# Altium project a4403-ELE-CAD.PrjPcb (part 3 of 4)

## Sheet JigInterface.SchDoc
size Letter; SheetNumber: 7; SheetTotal: 15
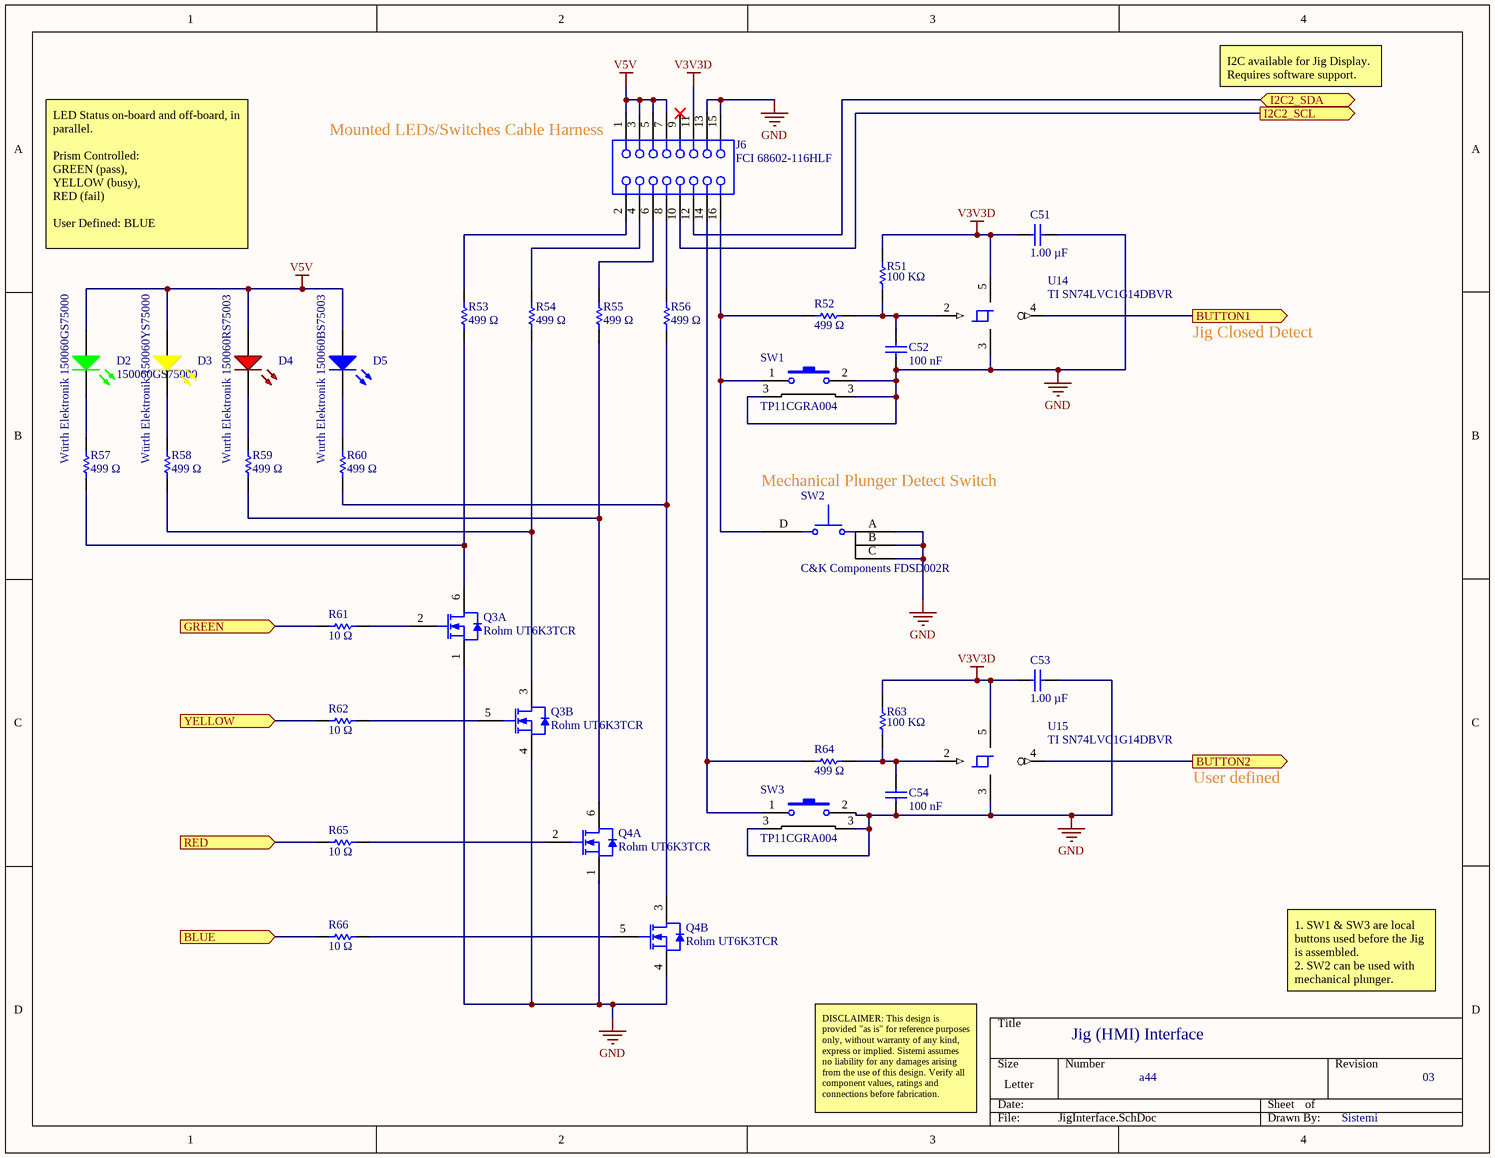
[diagram p8: JigInterface.SchDoc]

### Parts
C51  Capacitance: 1.00 µF  [CAPC1608X90X35NL15T15]  (hidden comment: Samsung CL10B105KA8NNNC)
C52  Capacitance: 100 nF  [CAPC1005X56X25NL10T15]  (hidden comment: Samsung CL05B104KO5NNNC)
C53  Capacitance: 1.00 µF  [CAPC1608X90X35NL15T15]  (hidden comment: Samsung CL10B105KA8NNNC)
C54  Capacitance: 100 nF  [CAPC1005X56X25NL10T15]  (hidden comment: Samsung CL05B104KO5NNNC)
D2  Würth Elektronik 150060GS75000  Manufacturer Part Number: 150060GS75000  [PCB-5fu3j7c0qqekthrt71i6-1]
D3  Würth Elektronik 150060YS75000  [PCB-zc2vv3u4p0giaiwimi3e-1]
D4  Wurth Elektronik 150060RS75003  [Wurth Elektronik 150060RS75003-Footprint-1]
D5  Wurth Elektronik 150060BS75003  [0603D_C]
J6  FCI 68602-116HLF  [HEADER8X2]
Q3  Rohm UT6K3TCR  [DFN2020-8D]  (parts A,B of 2)
Q4  Rohm UT6K3TCR  [DFN2020-8D]  (parts A,B of 2)
R51  Resistance: 100 KΩ  [RESC1005X40X25NL05T05]  (hidden comment: 100 KΩ,±1%,0402)
R52  Resistance: 499 Ω  [RESC1608X55X30ML15T15]  (hidden comment: Generic RES 0603)
R53  Resistance: 499 Ω  [RESC1608X55X30ML15T15]  (hidden comment: Generic RES 0603)
R54  Resistance: 499 Ω  [RESC1608X55X30ML15T15]  (hidden comment: Generic RES 0603)
R55  Resistance: 499 Ω  [RESC1608X55X30ML15T15]  (hidden comment: Generic RES 0603)
R56  Resistance: 499 Ω  [RESC1608X55X30ML15T15]  (hidden comment: Generic RES 0603)
R57  Resistance: 499 Ω  [RESC1608X55X30ML15T15]  (hidden comment: Generic RES 0603)
R58  Resistance: 499 Ω  [RESC1608X55X30ML15T15]  (hidden comment: Generic RES 0603)
R59  Resistance: 499 Ω  [RESC1608X55X30ML15T15]  (hidden comment: Generic RES 0603)
R60  Resistance: 499 Ω  [RESC1608X55X30ML15T15]  (hidden comment: Generic RES 0603)
R61  Resistance: 10 Ω  [RESC1005X40X25NL05T05]  (hidden comment: 10 Ω,±1%,0402)
R62  Resistance: 10 Ω  [RESC1005X40X25NL05T05]  (hidden comment: 10 Ω,±1%,0402)
R63  Resistance: 100 KΩ  [RESC1005X40X25NL05T05]  (hidden comment: 100 KΩ,±1%,0402)
R64  Resistance: 499 Ω  [RESC1608X55X30ML15T15]  (hidden comment: Generic RES 0603)
R65  Resistance: 10 Ω  [RESC1005X40X25NL05T05]  (hidden comment: 10 Ω,±1%,0402)
R66  Resistance: 10 Ω  [RESC1005X40X25NL05T05]  (hidden comment: 10 Ω,±1%,0402)
SW1  TP11CGRA004  [PCB-kxc5zoxy62rh6gxl0cji-1]
SW2  C&K Components FDSD002R  [FDSD002r]
SW3  TP11CGRA004  [PCB-kxc5zoxy62rh6gxl0cji-1]
U14  TI SN74LVC1G14DBVR  [TI-DBV5_M]
U15  TI SN74LVC1G14DBVR  [TI-DBV5_M]

### Ports
BLUE (in), BUTTON1 (out), BUTTON2 (out), GREEN (in), I2C2_SCL (out), I2C2_SDA (bidir), RED (in), YELLOW (in)

### Nets
3: Q3.8(D) Q4.8(D)
6: Q3.7(D) Q4.7(D)
GND: C51.1 C52.2 C53.1 C54.2 J6.13 J6.15 Q3.1(S) Q3.4(S) Q4.1(S) Q4.4(S) SW1.2 SW1.3 SW2.A SW2.B SW2.C SW3.2 SW3.3 U14.3 U15.3
V3V3D: C51.2 C53.2 J6.11 R51.2 R63.2 U14.5 U15.5
V5V: D2.2(A) D3.2(A) D4.1(A) D5.1(A) J6.1 J6.3 J6.5 J6.7
I2C2_SCL: J6.10 ; port I2C2_SCL
I2C2_SDA: J6.12 ; port I2C2_SDA
NetC52_1: C52.1 R51.1 R52.1 U14.2(A)
NetC54_1: C54.1 R63.1 R64.1 U15.2(A)
NetD2_1: D2.1(K) R57.2
NetD3_1: D3.1(K) R58.2
NetD4_2: D4.2(K) R59.2
NetD5_2: D5.2(K) R60.2
NetJ6_2: J6.2 R53.2
NetJ6_4: J6.4 R54.2
NetJ6_6: J6.6 R55.2
NetJ6_8: J6.8 R56.2
NetJ6_14: J6.14 R64.2 SW3.1
NetJ6_16: J6.16 R52.2 SW1.1 SW2.D
NetQ3_2: Q3.2(G) R61.1
NetQ3_3: Q3.3(D) R54.1 R58.1
NetQ3_5: Q3.5(G) R62.1
NetQ3_6: Q3.6(D) R53.1 R57.1
NetQ4_2: Q4.2(G) R65.1
NetQ4_3: Q4.3(D) R56.1 R60.1
NetQ4_5: Q4.5(G) R66.1
NetQ4_6: Q4.6(D) R55.1 R59.1
NetR61_2: R61.2 ; port GREEN
NetR62_2: R62.2 ; port YELLOW
NetR65_2: R65.2 ; port RED
NetR66_2: R66.2 ; port BLUE
NetU1_7: U14.4(Y) ; port BUTTON1
NetU1_8: U15.4(Y) ; port BUTTON2

Not connected (* = marked no-connect by the designer): J6 9*

### Notes on the sheet
- I2C available for Jig Display.  Requires software support.
- (near J6) Mounted LEDs/Switches Cable Harness
- LED Status on-board and off-board, in parallel.
  Prism Controlled:
  GREEN (pass),
  YELLOW (busy),
  RED (fail)
  User Defined: BLUE
- Jig Closed Detect
- (near SW2) Mechanical Plunger Detect Switch
- User defined
- Jig (HMI) Interface
- 1. SW1 & SW3 are local buttons used before the Jig is assembled.
  2. SW2 can be used with mechanical plunger.
- DISCLAIMER: This design is provided "as is" for reference purposes only, without warranty of any kind, express or implied. Sistemi assumes no liability for any damages arising from the use of this design. Verify all component values, ratings and connections before fabrication.
- a44
- 03
- Sistemi

### Library data of the parts
C51 C53 = CMP-7473528-5: CL Series 0603 1 uF 25 V ±10 % X7R Surface Mount Multilayer Ceramic Capacitor; Manufacturer Part Number: UMK107AB7105KA-T; Lead-Free Status: Lead Free; Capacitance Tolerance: ±10%; Voltage Rating (DC): 25.0 V; RoHS: Compliant; Mounting Style: Surface Mount; Footprint: PCB-0002-00062-3; Octopart URL: http://octopart.com/cl10b105ka8nnnc-samsung-19831597; Case/Package: 0603; OctopartID: ce7a065e703111bd; Dielectric Characteristic: X7R
C52 C54 = CMP-bf2276a55d9a60e5-19: Ceramic capacitor SMD-0402 100nF /16V X7R# K +-10%, Samsung, RoHS; Dielectric Characteristic: X7R; Lead-Free Status: Lead Free; Voltage Rating (DC): 16.0 V; Capacitance Tolerance: ±10%; Mounting Style: Surface Mount; Case/Package: 0402; OctopartID: 0755ced2c795d892; Footprint: PCB-0002-00476-3; Octopart URL: https://octopart.com/cl05b104ko5nnnc-samsung-9299366; RoHS: Compliant; Manufacturer Part Number: CL05B104KO5NNNC
D2 = CMP-12518857-12: Led, Green, 520 Nm, 3.2 V, 30 Ma, 430 Mcd Rohs Compliant: Yes; Footprint: PCC-0029-00260-1
D3 = CMP-12518863-13: Led, Yellow, 590 Nm, 2 V, 30 Ma, 120 Mcd Rohs Compliant: Yes; Forward Voltage: 2.00 V; Viewing Angle: 140 °; Luminous Intensity: 120 mcd; RoHS: Compliant; Footprint: PCB-rxfjlzgnb1funqct5a9u-1; OctopartID: fe0f36c1264421c8; REACH SVHC Compliance: No SVHC; Manufacturer Part Number: 150060YS75000; Octopart URL: https://octopart.com/150060ys75000-w%C3%BCrth+elektronik-29687085; Case/Package: 0603; Color: Yellow; Packaging: Tape & Reel (TR); Mounting Style: Surface Mount
D4 = CMP-1f4ad1c426c2c08d-4: SMT Mono-color Chip Led Watercle; OctopartID: 1f4ad1c426c2c08d; Manufacturer Part Number: 150060RS75003; Octopart Url: https://octopart.com/150060rs75003-wurth+elektronik-126098670
D5 = CMP-3fa7f129062de060-1: SMT Mono-Color Chip LED Waterclear Advance; Color: Blue; Voltage: 3.2V; Forward Current: 20mA; Octopart Url: https://octopart.com/150060bs75003-wurth+elektronik-126098668; Manufacturer Part Number: 150060BS75003; OctopartID: 3fa7f129062de060
J6 = CMP-429f8bf83f2c9d58-5: Conn Unshrouded Header HDR 16 POS 2.54mm Solder ST Thru-Hole Poly Bag; Number of Contacts: 16; Gender: Male; Octopart URL: http://octopart.com/68602-116hlf-fci-7166165; Pin Pitch: 2.54 mm; Packaging: Bulk; Contact Plating: Gold; Footprint: PCB-8dkjn6b77nx2tsqv24pv-3; OctopartID: 429f8bf83f2c9d58; Manufacturer Part Number: 68602-116HLF; Contact Material: Phosphor Bronze; RoHS: Compliant; Number of Rows: 2; Mounting Style: Through Hole
Q3 Q4 = CMP-7da2b0d499b7a265-2: On a Reel of 3000, Dual N-Channel MOSFET, 5.5 A, 30 V, 8-Pin DFN ROHM UT6K3TCR; Polarity: Dual N-Channel; Footprint: PCB-qj1nrqbgj5udp5r3frdj-1; RoHS: Compliant; OctopartID: 7da2b0d499b7a265; Manufacturer Part Number: UT6K3TCR; Operating Temperature: 150 °C (max); Octopart URL: https://octopart.com/ut6k3tcr-rohm-75284851
R51 R63 = CMP-3902036-3: Generic RES 0402, =Resistance+','+Tolerance+','+Case; Manufacturer Part Number: RT0402FRE07100KL; Lead-Free Status: Lead Free; Voltage: 50.0 V; Power: 0.063 W; Mounting Style: Surface Mount; RoHS: Compliant; Number of Pins: 2; Tolerance: ±1%; Octopart Url: TBD; Case: 0402; OctopartID: 26dced8948c2f91b
R52-R60 R64 = CMP-0800c38b3cf2d7c7-3: Generic RES 0603, =Resistance+','+Tolerance+','+Case; Manufacturer Part Number: MCT06030C4990FP500; Case/Package (SI): 1608; Lead-Free Status: Lead Free; Power Rating: 63.0 mW; Voltage: 50V; ELV Compliant: Compliant; Tolerance: ±1%; Temperature Coefficient: -50.0 ppm/°C to 50.0 ppm/°C; Octopart URL: TBD; Number of Pins: 2; Mounting Style: Surface Mount; Packaging: Tape & Reel (TR); Lifecycle Status: Active; RoHS: Compliant; Case: 0603; Operating Temperature: -55.0 °C to 125 °C; REACH SVHC Compliance: No SVHC; Footprint: PCB-0002-00066-3; OctopartID: a8e96364fc37772e
R61 R62 R65 R66 = CMP-3902036-3: Generic RES 0402, =Resistance+','+Tolerance+','+Case; Manufacturer Part Number: RT0402FRE0710RL; Lead-Free Status: Lead Free; Voltage: 50.0 V; Power: 0.063 W; Mounting Style: Surface Mount; RoHS: Compliant; Number of Pins: 2; Tolerance: ±1%; Octopart Url: TBD; Case: 0402; OctopartID: 26dced8948c2f91b
SW1 SW3 = CMP-1ee7d7ec700bc120-1: Switch, Pushbutton, Thru-Hole Mount, SPST, PC Mount, 1000 V (RMS) (Min.); Contact Resistance: 20.0 mΩ (max); ELV Compliant: Non-Compliant; Lead-Free Status: Contains Lead; Size-Width: 5.08 mm; Octopart URL: https://octopart.com/tp11cgra0-te+connectivity+%2F+alcoswitch-84874; Lifecycle Status: Active; Contacts Type: SPST; OctopartID: 1ee7d7ec700bc120; RoHS: Non-Compliant; Packaging: Bulk; Orientation: Right Angle; Size-Length: 8.13 mm; Manufacturer Part Number: TP11CGRA004; Contact Plating: Gold over Nickel; Operating Temperature: 65.0 °C (max); Contact Material: Copper Alloy; Mounting Style: Through Hole
SW2 = CMP-8f1943a01c3050de-6: Switch Detector Side Actuated OFF-MOM 10mA 5VDC 0.39N SPST-NO Flat Terminal Surface Mount T/R; Lead-Free Status: Lead Free; RoHS: Compliant; Octopart URL: https://octopart.com/fdsd002r-c%26k+components-95663695; Footprint: PCB-eidm0z1z6we3mnuhu73s-3; Manufacturer Part Number: FDSD002R; OctopartID: 8f1943a01c3050de
U14 U15 = CMP-19354130-5: IC SCHMITT TRIG INV SOT-23-5; Lead-Free Status: Lead Free; Propagation Delay Max (tpd): 5e-09 s; Output Current: 0.032 A; Number of Bits: 1; Supply Voltage (DC): 5.0 V; Output Current Drive: -0.001 A; REACH SVHC Compliance: No SVHC; OctopartID: 3234fb390160edf3; RoHS: Compliant; Manufacturer Part Number: SN74LVC1G14DBVR; Footprint: PCC-0151-00548-1; Octopart Url: https://octopart.com/sn74lvc1g14dbvr-texas+instruments-464434; Number of Pins: 5; Mounting Style: Surface Mount; Number of Circuits: 1; Number of Gates: 1; Lifecycle Status: Active; Case/Package: SOT-23

## Sheet PowerDist.SchDoc
size Letter; SheetNumber: 4; SheetTotal: 15
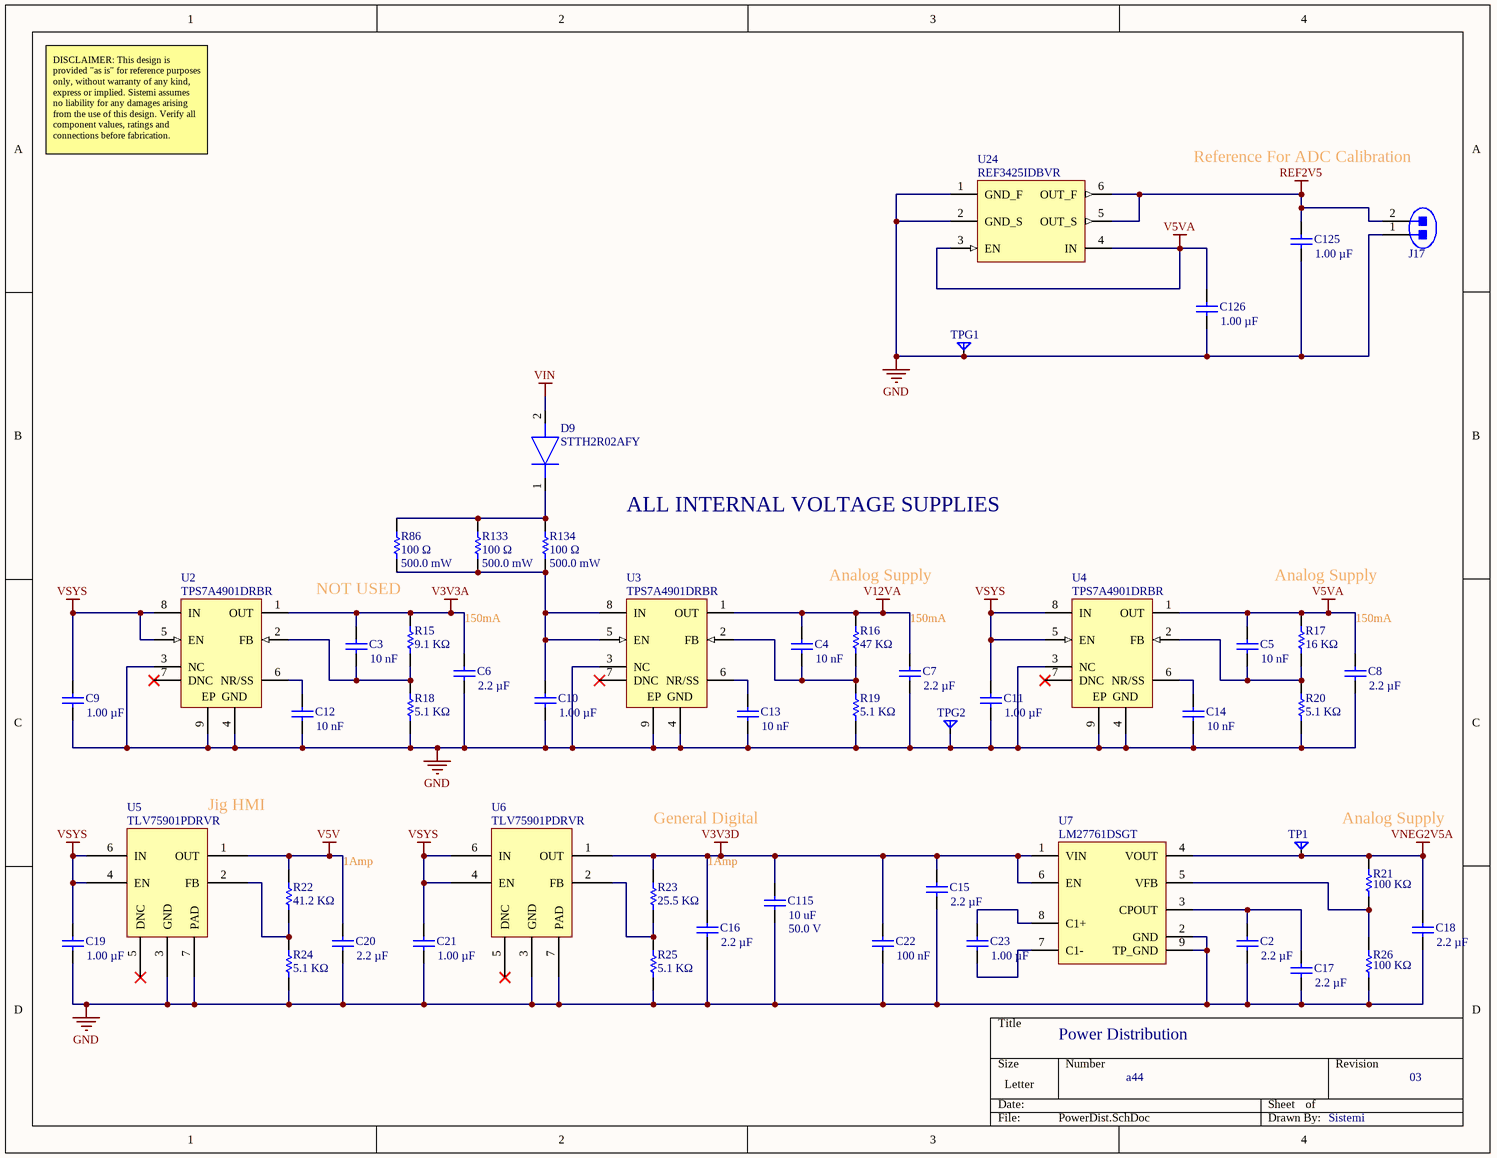
[diagram p9: PowerDist.SchDoc]

### Parts
C2  Capacitance: 2.2 µF  [CAPC1608X90X35NL15T15]  (hidden comment: 2.2 µF,±10%,25V,X7R,0603)
C3  Capacitance: 10 nF  [CAPC1005X56X25NL10T15]  (hidden comment: 10 nF,±10%,25V,CGO,0402)
C4  Capacitance: 10 nF  [CAPC1005X56X25NL10T15]  (hidden comment: 10 nF,±10%,25V,CGO,0402)
C5  Capacitance: 10 nF  [CAPC1005X56X25NL10T15]  (hidden comment: 10 nF,±10%,25V,CGO,0402)
C6  Capacitance: 2.2 µF  [CAPC1608X90X35NL15T15]  (hidden comment: 2.2 µF,±10%,25V,X7R,0603)
C7  Capacitance: 2.2 µF  [CAPC1608X90X35NL15T15]  (hidden comment: 2.2 µF,±10%,25V,X7R,0603)
C8  Capacitance: 2.2 µF  [CAPC1608X90X35NL15T15]  (hidden comment: 2.2 µF,±10%,25V,X7R,0603)
C9  Capacitance: 1.00 µF  [CAPC1608X90X35NL15T15]  (hidden comment: Samsung CL10B105KA8NNNC)
C10  Capacitance: 1.00 µF  [CAPC1608X90X35NL15T15]  (hidden comment: Samsung CL10B105KA8NNNC)
C11  Capacitance: 1.00 µF  [CAPC1608X90X35NL15T15]  (hidden comment: Samsung CL10B105KA8NNNC)
C12  Capacitance: 10 nF  [CAPC1005X56X25NL10T15]  (hidden comment: 10 nF,±10%,25V,CGO,0402)
C13  Capacitance: 10 nF  [CAPC1005X56X25NL10T15]  (hidden comment: 10 nF,±10%,25V,CGO,0402)
C14  Capacitance: 10 nF  [CAPC1005X56X25NL10T15]  (hidden comment: 10 nF,±10%,25V,CGO,0402)
C15  Capacitance: 2.2 µF  [CAPC1608X90X35NL15T15]  (hidden comment: 2.2 µF,±10%,25V,X7R,0603)
C16  Capacitance: 2.2 µF  [CAPC1608X90X35NL15T15]  (hidden comment: 2.2 µF,±10%,25V,X7R,0603)
C17  Capacitance: 2.2 µF  [CAPC1608X90X35NL15T15]  (hidden comment: 2.2 µF,±10%,25V,X7R,0603)
C18  Capacitance: 2.2 µF  [CAPC1608X90X35NL15T15]  (hidden comment: 2.2 µF,±10%,25V,X7R,0603)
C19  Capacitance: 1.00 µF  [CAPC1608X90X35NL15T15]  (hidden comment: Samsung CL10B105KA8NNNC)
C20  Capacitance: 2.2 µF  [CAPC1608X90X35NL15T15]  (hidden comment: 2.2 µF,±10%,25V,X7R,0603)
C21  Capacitance: 1.00 µF  [CAPC1608X90X35NL15T15]  (hidden comment: Samsung CL10B105KA8NNNC)
C22  Capacitance: 100 nF  [CAPC1005X56X25NL10T15]  (hidden comment: Samsung CL05B104KO5NNNC)
C23  Capacitance: 1.00 µF  [CAPC1608X90X35NL15T15]  (hidden comment: Samsung CL10B105KA8NNNC)
C115  Capacitance: 10 uF  Voltage Rating (DC): 50.0 V  [CAPC3216X180X55LL20T25]  (hidden comment: Murata GRM31CR61H106KA12L)
C125  Capacitance: 1.00 µF  [CAPC1608X90X35NL15T15]  (hidden comment: Samsung CL10B105KA8NNNC)
C126  Capacitance: 1.00 µF  [CAPC1608X90X35NL15T15]  (hidden comment: Samsung CL10B105KA8NNNC)
D9  STTH2R02AFY  [SODFL4724X103N]
J17  TE Connectivity / AMP 5-146280-2  [PCB-nx47vqovjjduu8dkc1uz-1]  (value not drawn)
R15  Resistance: 9.1 KΩ  [RESC1608X55X30ML15T15]  (hidden comment: Generic RES 0603)
R16  Resistance: 47 KΩ  [RESC1608X55X30LL15T15]  (hidden comment: Generic RES 0603)
R17  Resistance: 16 KΩ  [RESC1608X55X30ML15T15]  (hidden comment: Generic RES 0603)
R18  Resistance: 5.1 KΩ  [RESC1608X55X30ML15T15]  (hidden comment: Generic RES 0603)
R19  Resistance: 5.1 KΩ  [RESC1608X55X30LL15T15]  (hidden comment: Generic RES 0603)
R20  Resistance: 5.1 KΩ  [RESC1608X55X30ML15T15]  (hidden comment: Generic RES 0603)
R21  Resistance: 100 KΩ  [RESC1005X40X25NL05T05]  (hidden comment: 100 KΩ,±1%,0402)
R22  Resistance: 41.2 KΩ  [RESC1608X55X30LL15T15]  (hidden comment: Generic RES 0603)
R23  Resistance: 25.5 KΩ  [RESC1608X55X30ML15T15]  (hidden comment: Generic RES 0603)
R24  Resistance: 5.1 KΩ  [RESC1608X55X30LL15T15]  (hidden comment: Generic RES 0603)
R25  Resistance: 5.1 KΩ  [RESC1608X55X30ML15T15]  (hidden comment: Generic RES 0603)
R26  Resistance: 100 KΩ  [RESC1005X40X25NL05T05]  (hidden comment: 100 KΩ,±1%,0402)
R86  Power Rating: 500.0 mW  Resistance: 100 Ω  [RESC1608X55X30ML15T15]  (hidden comment: Generic RES 0603)
R133  Power Rating: 500.0 mW  Resistance: 100 Ω  [RESC1608X55X30ML15T15]  (hidden comment: Generic RES 0603)
R134  Power Rating: 500.0 mW  Resistance: 100 Ω  [RESC1608X55X30ML15T15]  (hidden comment: Generic RES 0603)
TP1  Test Point Pad  [PCB-w5299rxaittb4m04ntfs-1]  (value not drawn)
TPG1  Test Point Pad  [PCB-w5299rxaittb4m04ntfs-1]  (value not drawn)
TPG2  Test Point Pad  [PCB-w5299rxaittb4m04ntfs-1]  (value not drawn)
U2  TPS7A4901DRBR  [TI-DRB8-1750X1500TP_V]
U3  TPS7A4901DRBR  [TI-DRB8-1750X1500TP_V]
U4  TPS7A4901DRBR  [TI-DRB8-1750X1500TP_V]
U5  TLV75901PDRVR  [PCB-ude52gq66msu1251nhm5-1]
U6  TLV75901PDRVR  [PCB-ude52gq66msu1251nhm5-1]
U7  LM27761DSGT  [PCB-4n89rivuw3spi8alca02-1]
U24  REF3425IDBVR  [PCB-iii9p4hirjo0din0ylk5-1]

### Nets
GND: C2.1 C6.1 C7.1 C8.1 C9.1 C10.1 C11.1 C12.1 C13.1 C14.1 C15.1 C16.1 C17.1 C18.1 C19.1 C20.1 C21.1 C22.1 C115.1 C125.1 C126.1 J17.1 R18.1 R19.1 R20.1 R24.1 R25.1 R26.1 TPG1.1(A) TPG2.1(A) U2.3(NC) U2.4(GND) U2.9(EP) U3.3(NC) U3.4(GND) U3.9(EP) U4.3(NC) U4.4(GND) U4.9(EP) U5.3(GND) U5.7(PAD) U6.3(GND) U6.7(PAD) U7.2(GND) U7.9(TP_GND) U24.1(GND_F) U24.2(GND_S)
REF2V5: C125.2 J17.2 U24.5(OUT_S) U24.6(OUT_F)
V3V3A: C3.2 C6.2 R15.2 U2.1(OUT)
V3V3D: C15.2 C16.2 C22.2 C115.2 R23.2 U6.1(OUT) U7.1(VIN) U7.6(EN)
V5V: C20.2 R22.2 U5.1(OUT)
V5VA: C5.2 C8.2 C126.2 R17.2 U4.1(OUT) U24.3(EN) U24.4(IN)
V12VA: C4.2 C7.2 R16.2 U3.1(OUT)
VIN: D9.2(A)
VNEG2V5A: C18.2 R21.2 TP1.1(A) U7.4(VOUT)
VSYS: C9.2 C11.2 C19.2 C21.2 U2.5(EN) U2.8(IN) U4.5(EN) U4.8(IN) U5.4(EN) U5.6(IN) U6.4(EN) U6.6(IN)
NetC2_2: C2.2 C17.2 U7.3(CPOUT)
NetC3_1: C3.1 R15.1 R18.2 U2.2(FB)
NetC4_1: C4.1 R16.1 R19.2 U3.2(FB)
NetC5_1: C5.1 R17.1 R20.2 U4.2(FB)
NetC10_2: C10.2 R86.1 R133.1 R134.1 U3.5(EN) U3.8(IN)
NetC12_2: C12.2 U2.6(NR/SS)
NetC13_2: C13.2 U3.6(NR/SS)
NetC14_2: C14.2 U4.6(NR/SS)
NetC23_1: C23.1 U7.7(C1-)
NetC23_2: C23.2 U7.8(C1+)
NetD9_1: D9.1(K) R86.2 R133.2 R134.2
NetR21_1: R21.1 R26.2 U7.5(VFB)
NetR22_1: R22.1 R24.2 U5.2(FB)
NetR23_1: R23.1 R25.2 U6.2(FB)

Not connected (* = marked no-connect by the designer): U2 7(DNC)*; U3 7(DNC)*; U4 7(DNC)*; U5 5(DNC)*; U6 5(DNC)*

### Notes on the sheet
- DISCLAIMER: This design is provided "as is" for reference purposes only, without warranty of any kind, express or implied. Sistemi assumes no liability for any damages arising from the use of this design. Verify all component values, ratings and connections before fabrication.
- Reference For ADC Calibration
- ALL INTERNAL VOLTAGE SUPPLIES
- NOT USED
- 150mA
- Analog Supply
- (near U5) Jig HMI
- General Digital
- 1Amp
- Power Distribution
- a44
- 03
- Sistemi

### Library data of the parts
C2 C6-C8 C15-C18 C20 = CMP-7473528-7: Generic CAP 0603, =Capacitance+','+Tolerance+','+Voltage+','+Dielectric; Manufacturer Part Number: GRM188Z71E225KE43D; Lead-Free Status: Lead Free; RoHS: Compliant; Voltage: 25V; Footprint: PCB-0002-00062-3; Dielectric: X7R; Tolerance: ±10%; OctopartID: ce7a065e703111bd; Mounting Style: Surface Mount; Octopart URL: TBD; Case: 0603
C3-C5 C12-C14 = CMP-bf2276a55d9a60e5-20: Generic CAP 0402, =Capacitance+','+Tolerance+','+Voltage+','+Dielectric+','+Case; Manufacturer Part Number: GRM1555C1E103JE01J; Lead-Free Status: Lead Free; Octopart URL: TBD; Case: 0402; OctopartID: 0755ced2c795d892; Voltage: 25V; Dielectric: CGO; RoHS: Compliant; Mounting Style: Surface Mount; Tolerance: ±10%; Footprint: PCB-0002-00476-3
C9-C11 C19 C21 C23 C125 C126 = CMP-7473528-5: as C51 on sheet JigInterface; RoHS: Compliant; Mounting Style: Surface Mount; Footprint: PCB-0002-00062-3; Octopart URL: http://octopart.com/cl10b105ka8nnnc-samsung-19831597; Case/Package: 0603; OctopartID: ce7a065e703111bd; Dielectric Characteristic: X7R
C22 = CMP-bf2276a55d9a60e5-19: as C52 on sheet JigInterface; Mounting Style: Surface Mount; Case/Package: 0402; OctopartID: 0755ced2c795d892; Footprint: PCB-0002-00476-3; Octopart URL: https://octopart.com/cl05b104ko5nnnc-samsung-9299366; RoHS: Compliant; Manufacturer Part Number: CL05B104KO5NNNC
C115 = CMP-3554908-2: Multilayer Ceramic Capacitors MLCC - SMD/SMT 1206 10uF 50volt X5R +/-10%; Manufacturer Part Number: CL31B106KBHNNNE; Capacitance Tolerance: ±10%; Case/Package (SI): 3216; Lead-Free Status: Lead Free; Dielectric Characteristic: X5R; Lifecycle Status: Active; Mounting Style: Surface Mount; Number of Pins: 2; Octopart Url: https://octopart.com/grm31cr61h106ka12l-murata-18903335; OctopartID: fd8535afa9c42242; Packaging: Cut Tape (CT); REACH SVHC Compliance: No SVHC; RoHS: Compliant; Size-Length: 0.0032 m; Size-Thickness: 0.0016 m; Size-Width: 0.0016 m
D9 = STTH2R02AFY: Diode; Manufacturer_Name: STMicroelectronics; Datasheet Link: https://www.st.com/resource/en/datasheet/stth2r02af-y.pdf; Height: 1.03mm; Manufacturer Part Number: STTH2R02AFY; Mouser Part Number: 511-STTH2R02AFY; Mouser Price/Stock: https://www.mouser.co.uk/ProductDetail/STMicroelectronics/STTH2R02AFY?qs=pZIKbki37pqpUMRfOtxSog%3D%3D; Arrow Part Number: STTH2R02AFY; Arrow Price/Stock: https://www.arrow.com/en/products/stth2r02afy/stmicroelectronics
J17 = CMP-876e4e6699ef58a9-5: 2 Positions Header, Unshrouded, Breakaway Connector 0.100" (2.54mm) Through Hole Gold; Vendor Part Number: A121480-ND; Manufacturer: TE Connectivity AMP Connectors; Vendor: Digikey; Number of Positions: 2; Contact Type: Male Pin; Octopart URL: http://octopart.com/5-146280-2-te+connectivity+%2F+amp-39436426; Contact Finish: Gold; HelpURL: http://www.te.com/commerce/DocumentDelivery/DDEController?Action=srchrtrv&DocNm=146280&DocType=Customer+Drawing&DocLang=English; Cost: 0.43; Contact Mating Length: 0.230" (5.84mm); Mounting Type: Through Hole; Family: Rectangular Connectors - Headers, Male Pins; Connector Type: Header, Unshrouded, Breakaway; Category: Connectors, Interconnects; Number of Rows: 1; Pitch: Header, Unshrouded, Breakaway; Manufacturer Part Number: 5-146280-2; Contact Finish Thickness: 15µin (0.38µm); OctopartID: 3545fe16d0a9ea82
R15 = CMP-0800c38b3cf2d7c7-3: Generic RES 0603, =Resistance+','+Tolerance+','+Case; Manufacturer Part Number: RT0603FRE079K1L; Case/Package (SI): 1608; Lead-Free Status: Lead Free; Power Rating: 63.0 mW; Voltage: 50V; ELV Compliant: Compliant; Tolerance: ±1%; Temperature Coefficient: -50.0 ppm/°C to 50.0 ppm/°C; Octopart URL: TBD; Number of Pins: 2; Mounting Style: Surface Mount; Packaging: Tape & Reel (TR); Lifecycle Status: Active; RoHS: Compliant; Case: 0603; Operating Temperature: -55.0 °C to 125 °C; REACH SVHC Compliance: No SVHC; Footprint: PCB-0002-00066-3; OctopartID: a8e96364fc37772e
R16 = CMP-0800c38b3cf2d7c7-3: Generic RES 0603, =Resistance+','+Tolerance+','+Case; Manufacturer Part Number: RT0603FRE1347KL; Case/Package (SI): 1608; Lead-Free Status: Lead Free; Power Rating: 63.0 mW; Voltage: 50V; ELV Compliant: Compliant; Tolerance: ±1%; Temperature Coefficient: -50.0 ppm/°C to 50.0 ppm/°C; Octopart URL: TBD; Number of Pins: 2; Mounting Style: Surface Mount; Packaging: Tape & Reel (TR); Lifecycle Status: Active; RoHS: Compliant; Case: 0603; Operating Temperature: -55.0 °C to 125 °C; REACH SVHC Compliance: No SVHC; Footprint: PCB-0002-00066-3; OctopartID: a8e96364fc37772e
R17 = CMP-0800c38b3cf2d7c7-3: Generic RES 0603, =Resistance+','+Tolerance+','+Case; Manufacturer Part Number: MCT06030C1602FP500; Case/Package (SI): 1608; Lead-Free Status: Lead Free; Power Rating: 63.0 mW; Voltage: 50V; ELV Compliant: Compliant; Tolerance: ±1%; Temperature Coefficient: -50.0 ppm/°C to 50.0 ppm/°C; Octopart URL: TBD; Number of Pins: 2; Mounting Style: Surface Mount; Packaging: Tape & Reel (TR); Lifecycle Status: Active; RoHS: Compliant; Case: 0603; Operating Temperature: -55.0 °C to 125 °C; REACH SVHC Compliance: No SVHC; Footprint: PCB-0002-00066-3; OctopartID: a8e96364fc37772e
R18-R20 R24 R25 = CMP-0800c38b3cf2d7c7-3: Generic RES 0603, =Resistance+','+Tolerance+','+Case; Manufacturer Part Number: RT0603FRE075K1L; Case/Package (SI): 1608; Lead-Free Status: Lead Free; Power Rating: 63.0 mW; Voltage: 50V; ELV Compliant: Compliant; Tolerance: ±1%; Temperature Coefficient: -50.0 ppm/°C to 50.0 ppm/°C; Octopart URL: TBD; Number of Pins: 2; Mounting Style: Surface Mount; Packaging: Tape & Reel (TR); Lifecycle Status: Active; RoHS: Compliant; Case: 0603; Operating Temperature: -55.0 °C to 125 °C; REACH SVHC Compliance: No SVHC; Footprint: PCB-0002-00066-3; OctopartID: a8e96364fc37772e
R21 R26 = CMP-3902036-3: as R51 on sheet JigInterface; Mounting Style: Surface Mount; RoHS: Compliant; Number of Pins: 2; Tolerance: ±1%; Octopart Url: TBD; Case: 0402; OctopartID: 26dced8948c2f91b
R22 = CMP-0800c38b3cf2d7c7-3: Generic RES 0603, =Resistance+','+Tolerance+','+Case; Manufacturer Part Number: RT0603BRE0741K2L; Case/Package (SI): 1608; Lead-Free Status: Lead Free; Power Rating: 63.0 mW; Voltage: 50V; ELV Compliant: Compliant; Tolerance: ±1%; Temperature Coefficient: -50.0 ppm/°C to 50.0 ppm/°C; Octopart URL: TBD; Number of Pins: 2; Mounting Style: Surface Mount; Packaging: Tape & Reel (TR); Lifecycle Status: Active; RoHS: Compliant; Case: 0603; Operating Temperature: -55.0 °C to 125 °C; REACH SVHC Compliance: No SVHC; Footprint: PCB-0002-00066-3; OctopartID: a8e96364fc37772e
R23 = CMP-0800c38b3cf2d7c7-3: Generic RES 0603, =Resistance+','+Tolerance+','+Case; Manufacturer Part Number: RT0603FRE0725K5L; Case/Package (SI): 1608; Lead-Free Status: Lead Free; Power Rating: 63.0 mW; Voltage: 50V; ELV Compliant: Compliant; Tolerance: ±1%; Temperature Coefficient: -50.0 ppm/°C to 50.0 ppm/°C; Octopart URL: TBD; Number of Pins: 2; Mounting Style: Surface Mount; Packaging: Tape & Reel (TR); Lifecycle Status: Active; RoHS: Compliant; Case: 0603; Operating Temperature: -55.0 °C to 125 °C; REACH SVHC Compliance: No SVHC; Footprint: PCB-0002-00066-3; OctopartID: a8e96364fc37772e
R86 R133 R134 = CMP-0800c38b3cf2d7c7-3: Generic RES 0603, =Resistance+','+Tolerance+','+Case; Manufacturer Part Number: SG73S1JTTD101J; Case/Package (SI): 1608; Lead-Free Status: Lead Free; Voltage: 50V; ELV Compliant: Compliant; Tolerance: ±1%; Temperature Coefficient: -50.0 ppm/°C to 50.0 ppm/°C; Octopart URL: TBD; Number of Pins: 2; Mounting Style: Surface Mount; Packaging: Tape & Reel (TR); Lifecycle Status: Active; RoHS: Compliant; Case: 0603; Operating Temperature: -55.0 °C to 125 °C; REACH SVHC Compliance: No SVHC; Footprint: PCB-0002-00066-3; OctopartID: a8e96364fc37772e
TP1 TPG1 TPG2 = CMP-lokszv1vctu4w47553pe-6: Test Point
U2-U4 = CMP-6782ad9879f0b845-2: IC REG LDO ADJ 0.15A 8SON / LDO Regulator Pos 1.194V to 33V 0.15A 8-Pin VSON EP T/R; Number of Regulated Outputs: 1; Quiescent Current: 800.0 µA; Dropout Voltage: 300 mV; Output Capacitor Type: Ceramic; Lead-Free Status: RoHS & Green; RoHS: Compliant; Manufacturer Part Number: TPS7A4901DRBR; Packaging: Tape & Reel (TR); Octopart Url: https://octopart.com/tps7a4901drbr-texas+instruments-51395348; Number of Pins: 8; Operating Temperature: -40.0 °C to 125 °C; OctopartID: 6782ad9879f0b845; Lifecycle Status: Pre-Release; Mounting Style: Surface Mount
U5 U6 = CMP-2b7ce7b2db7ff4bb-4: LDO Regulator Pos 0.55V to 5.5V 1A 6-Pin WSON EP T/R; Dropout Voltage: 190 mV; Number of Regulated Outputs: 1; Output Capacitor Type: Ceramic; Quiescent Current: 25.0 µA; OctopartID: 2b7ce7b2db7ff4bb; Manufacturer Part Number: TLV75901PDRVR; Footprint: PCB-6kp9dl1mk9yrlugndkjx-1; RoHS: Compliant; Octopart URL: https://octopart.com/tlv75901pdrvr-texas+instruments-96785765; Number of Pins: 6; Lifecycle Status: Pre-Release; Case/Package: WSON; Operating Temperature: -40.0 °C to 125 °C
U7 = CMP-6c42a6b0b832b385-2: Low-Noise regulated Switched Capacitor Voltage Inverter 8-WSON -40 to 85; Quiescent Current: 370 µA; Lead-Free Status: Lead Free; Output Voltage: -5.00 V (min); Number of Regulated Outputs: 1; Output Current: 250 mA; RoHS: Compliant; Mounting Style: Surface Mount; Number of Pins: 8; Manufacturer Part Number: LM27761DSGT; Octopart URL: http://octopart.com/lm27761dsgt-texas+instruments-66646294; Packaging: Cut Tape (CT); Lifecycle Status: Active; Footprint: PCB-j228smfc5dpw7all0w6z-1; OctopartID: 6c42a6b0b832b385; Case/Package: WSON
U24 = CMP-450589207bdc9ac2-1: 2.5-V low-drift low-power small-footprint series voltage reference 6-SOT-23 -40 to 125; Temperature Coefficient: 2.50 ppm/°C; Quiescent Current: 72.0 µA; Packaging: Cut Tape (CT); Octopart URL: https://octopart.com/ref3425idbvr-texas+instruments-86973375; RoHS: Compliant; Lifecycle Status: Pre-Release; Case/Package: SOT-23; OctopartID: 450589207bdc9ac2; Number of Pins: 6; Manufacturer Part Number: REF3425IDBVR; Operating Temperature: -40.0 °C (min)

## Sheet VDUT.SchDoc
size Letter; SheetNumber: 6; SheetTotal: 15
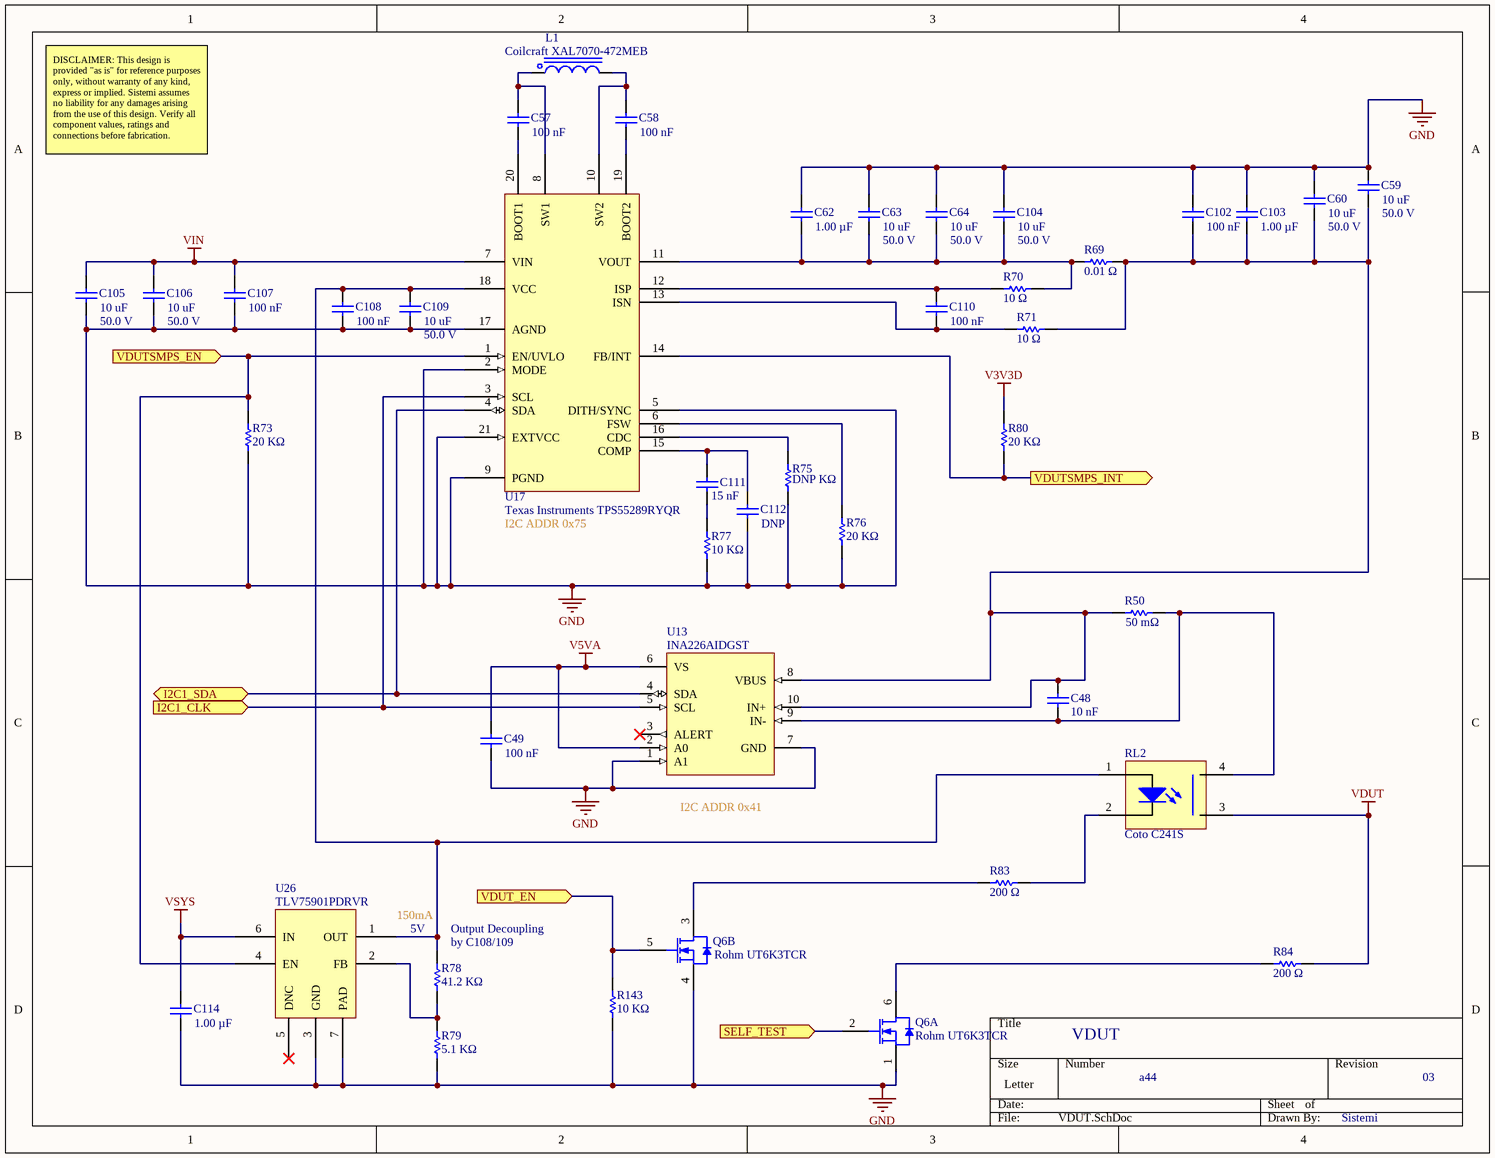
[diagram p10: VDUT.SchDoc]

### Parts
C48  Capacitance: 10 nF  [CAPC1005X56X25NL10T15]  (hidden comment: 10 nF,±10%,25V,CGO,0402)
C49  Capacitance: 100 nF  [CAPC1005X56X25NL10T15]  (hidden comment: Samsung CL05B104KO5NNNC)
C57  Capacitance: 100 nF  [CAPC1005X56X25NL10T15]  (hidden comment: Samsung CL05B104KO5NNNC)
C58  Capacitance: 100 nF  [CAPC1005X56X25NL10T15]  (hidden comment: Samsung CL05B104KO5NNNC)
C59  Capacitance: 10 uF  Voltage Rating (DC): 50.0 V  [CAPC3216X180X55LL20T25]  (hidden comment: Murata GRM31CR61H106KA12L)
C60  Capacitance: 10 uF  Voltage Rating (DC): 50.0 V  [CAPC3216X180X55LL20T25]  (hidden comment: Murata GRM31CR61H106KA12L)
C62  Capacitance: 1.00 µF  [CAPC1608X90X35NL15T15]  (hidden comment: Samsung CL10B105KA8NNNC)
C63  Capacitance: 10 uF  Voltage Rating (DC): 50.0 V  [CAPC3216X180X55LL20T25]  (hidden comment: Murata GRM31CR61H106KA12L)
C64  Capacitance: 10 uF  Voltage Rating (DC): 50.0 V  [CAPC3216X180X55LL20T25]  (hidden comment: Murata GRM31CR61H106KA12L)
C102  Capacitance: 100 nF  [CAPC1005X56X25NL10T15]  (hidden comment: Samsung CL05B104KO5NNNC)
C103  Capacitance: 1.00 µF  [CAPC1608X90X35NL15T15]  (hidden comment: Samsung CL10B105KA8NNNC)
C104  Capacitance: 10 uF  Voltage Rating (DC): 50.0 V  [CAPC3216X180X55LL20T25]  (hidden comment: Murata GRM31CR61H106KA12L)
C105  Capacitance: 10 uF  Voltage Rating (DC): 50.0 V  [CAPC3216X180X55LL20T25]  (hidden comment: Murata GRM31CR61H106KA12L)
C106  Capacitance: 10 uF  Voltage Rating (DC): 50.0 V  [CAPC3216X180X55LL20T25]  (hidden comment: Murata GRM31CR61H106KA12L)
C107  Capacitance: 100 nF  [CAPC1005X56X25NL10T15]  (hidden comment: Samsung CL05B104KO5NNNC)
C108  Capacitance: 100 nF  [CAPC1005X56X25NL10T15]  (hidden comment: Samsung CL05B104KO5NNNC)
C109  Capacitance: 10 uF  Voltage Rating (DC): 50.0 V  [CAPC3216X180X55LL20T25]  (hidden comment: Murata GRM31CR61H106KA12L)
C110  Capacitance: 100 nF  [CAPC1005X56X25NL10T15]  (hidden comment: Samsung CL05B104KO5NNNC)
C111  Capacitance: 15 nF  [CAPC1005X56X25NL10T15]  (hidden comment: 15 nF,±10%,25V,CGO,0402)
C112  Capacitance: DNP  [CAPC1005X56X25NL10T15]  (hidden comment: DNP,±10%,25V,CGO,0402)
C114  Capacitance: 1.00 µF  [CAPC1608X90X35NL15T15]  (hidden comment: Samsung CL10B105KA8NNNC)
L1  Coilcraft XAL7070-472MEB  [PCB-mw0ri1kelkujqd8k45jk-1]
Q6  Rohm UT6K3TCR  [DFN2020-8D]  (parts A,B of 2)
R50  Resistance: 50 mΩ  [RESC1608X55X30ML15T15]  (hidden comment: Generic RES 0603)
R69  Resistance: 0.01 Ω  [RESC1005X40X25NL05T05]  (hidden comment: 0.01 Ω,±1%,0402)
R70  Resistance: 10 Ω  [RESC1005X40X25NL05T05]  (hidden comment: 10 Ω,±1%,0402)
R71  Resistance: 10 Ω  [RESC1005X40X25NL05T05]  (hidden comment: 10 Ω,±1%,0402)
R73  Resistance: 20 KΩ  [RESC1608X55X30ML15T15]  (hidden comment: Generic RES 0603)
R75  Resistance: DNP KΩ  [RESC1005X40X25NL05T05]  (hidden comment: DNP KΩ,±1%,0402)
R76  Resistance: 20 KΩ  [RESC1608X55X30ML15T15]  (hidden comment: Generic RES 0603)
R77  Resistance: 10 KΩ  [RESC1608X55X30ML15T15]  (hidden comment: Generic RES 0603)
R78  Resistance: 41.2 KΩ  [RESC1608X55X30LL15T15]  (hidden comment: Generic RES 0603)
R79  Resistance: 5.1 KΩ  [RESC1608X55X30LL15T15]  (hidden comment: Generic RES 0603)
R80  Resistance: 20 KΩ  [RESC1608X55X30ML15T15]  (hidden comment: Generic RES 0603)
R83  Resistance: 200 Ω  [RESC1608X55X30LL15T15]  (hidden comment: Generic RES 0603)
R84  Resistance: 200 Ω  [RESC1608X55X30LL15T15]  (hidden comment: Generic RES 0603)
R143  Resistance: 10 KΩ  [RESC1608X55X30LL15T15]  (hidden comment: Generic RES 0603)
RL2  Coto C241S  [PCB-o1m8470la7x8r6xoffbd-1]
U13  INA226AIDGST  [TSSOP10]
U17  Texas Instruments TPS55289RYQR  [DSG8-1600X900TP]
U26  TLV75901PDRVR  [PCB-ude52gq66msu1251nhm5-1]

### Ports
I2C1_CLK (in), I2C1_SDA (bidir), SELF_TEST (in), VDUT_EN (in), VDUTSMPS_EN (in), VDUTSMPS_INT (out)

### Nets
3: Q6.8(D)
6: Q6.7(D)
GND: C49.1 C59.2 C60.2 C62.2 C63.2 C64.2 C102.2 C103.2 C104.2 C105.1 C106.1 C107.1 C108.1 C109.1 C112.1 C114.1 Q6.1(S) Q6.4(S) R73.1 R75.1 R76.1 R77.2 R79.1 R143.1 U13.1(A1) U13.7(GND) U17.2(MODE) U17.5(DITH/SYNC) U17.9(PGND) U17.17(AGND) U17.21(EXTVCC) U26.3(GND) U26.7(PAD)
V3V3D: R80.2
V5VA: C49.2 U13.2(A0) U13.6(VS)
VDUT: R84.1 RL2.3(S)
VIN: C105.2 C106.2 C107.2 U17.7(VIN)
VSYS: C114.2 U26.6(IN)
I2C1_CLK: U13.5(SCL) U17.3(SCL) ; port I2C1_CLK
I2C1_SDA: U13.4(SDA) U17.4(SDA) ; port I2C1_SDA
VDUT_EN: Q6.5(G) R143.2 ; port VDUT_EN
VDUTSMPS_EN: R73.2 U17.1(EN/UVLO) U26.4(EN) ; port VDUTSMPS_EN
VDUTSMPS_INT: R80.1 U17.14(FB/INT) ; port VDUTSMPS_INT
NetC48_1: C48.1 R50.2 RL2.4(D) U13.9(IN-)
NetC48_2: C48.2 C59.1 C60.1 C102.1 C103.1 R50.1 R69.1 R71.1 U13.8(VBUS) U13.10(IN+)
NetC57_1: C57.1 U17.20(BOOT1)
NetC57_2: C57.2 L1.2 U17.8(SW1)
NetC58_1: C58.1 U17.19(BOOT2)
NetC58_2: C58.2 L1.1 U17.10(SW2)
NetC62_1: C62.1 C63.1 C64.1 C104.1 R69.2 R70.1 U17.11(VOUT)
NetC108_2: C108.2 C109.2 R78.2 RL2.1(A) U17.18(VCC) U26.1(OUT)
NetC110_1: C110.1 R71.2 U17.13(ISN)
NetC110_2: C110.2 R70.2 U17.12(ISP)
NetC111_1: C111.1 R77.1
NetC111_2: C111.2 C112.2 U17.15(COMP)
NetQ1_5: Q6.2(G) ; port SELF_TEST
NetQ6_3: Q6.3(D) R83.2
NetQ6_6: Q6.6(D) R84.2
NetR75_2: R75.2 U17.16(CDC)
NetR76_2: R76.2 U17.6(FSW)
NetR78_1: R78.1 R79.2 U26.2(FB)
NetR83_1: R83.1 RL2.2(K)

Not connected (* = marked no-connect by the designer): U13 3(ALERT)*; U26 5(DNC)*

### Notes on the sheet
- DISCLAIMER: This design is provided "as is" for reference purposes only, without warranty of any kind, express or implied. Sistemi assumes no liability for any damages arising from the use of this design. Verify all component values, ratings and connections before fabrication.
- (near U17) I2C ADDR 0x75
- (near U13) I2C ADDR 0x41
- 150mA
- (near R78) 5V
- (near R78) Output Decoupling
- (near R78) by C108/109
- VDUT
- a44
- 03
- Sistemi

### Library data of the parts
C48 = CMP-bf2276a55d9a60e5-20: as C3-C5 on sheet PowerDist; Octopart URL: TBD; Case: 0402; OctopartID: 0755ced2c795d892; Voltage: 25V; Dielectric: CGO; RoHS: Compliant; Mounting Style: Surface Mount; Tolerance: ±10%; Footprint: PCB-0002-00476-3
C49 C57 C58 C102 C107 C108 C110 = CMP-bf2276a55d9a60e5-19: as C52 on sheet JigInterface; Mounting Style: Surface Mount; Case/Package: 0402; OctopartID: 0755ced2c795d892; Footprint: PCB-0002-00476-3; Octopart URL: https://octopart.com/cl05b104ko5nnnc-samsung-9299366; RoHS: Compliant; Manufacturer Part Number: CL05B104KO5NNNC
C59 C60 C63 C64 C104-C106 C109 = CMP-3554908-2: as C115 on sheet PowerDist; Dielectric Characteristic: X5R; Lifecycle Status: Active; Mounting Style: Surface Mount; Number of Pins: 2; Octopart Url: https://octopart.com/grm31cr61h106ka12l-murata-18903335; OctopartID: fd8535afa9c42242; Packaging: Cut Tape (CT); REACH SVHC Compliance: No SVHC; RoHS: Compliant; Size-Length: 0.0032 m; Size-Thickness: 0.0016 m; Size-Width: 0.0016 m
C62 C103 C114 = CMP-7473528-5: as C51 on sheet JigInterface; RoHS: Compliant; Mounting Style: Surface Mount; Footprint: PCB-0002-00062-3; Octopart URL: http://octopart.com/cl10b105ka8nnnc-samsung-19831597; Case/Package: 0603; OctopartID: ce7a065e703111bd; Dielectric Characteristic: X7R
C111 = CMP-bf2276a55d9a60e5-20: Generic CAP 0402, =Capacitance+','+Tolerance+','+Voltage+','+Dielectric+','+Case; Manufacturer Part Number: CGA2B3X7R1H153K050BB; Lead-Free Status: Lead Free; Octopart URL: TBD; Case: 0402; OctopartID: 0755ced2c795d892; Voltage: 25V; Dielectric: CGO; RoHS: Compliant; Mounting Style: Surface Mount; Tolerance: ±10%; Footprint: PCB-0002-00476-3
C112 = CMP-bf2276a55d9a60e5-20: Generic CAP 0402, =Capacitance+','+Tolerance+','+Voltage+','+Dielectric+','+Case; Manufacturer Part Number: TBD; Lead-Free Status: Lead Free; Octopart URL: TBD; Case: 0402; OctopartID: 0755ced2c795d892; Voltage: 25V; Dielectric: CGO; RoHS: Compliant; Mounting Style: Surface Mount; Tolerance: ±10%; Footprint: PCB-0002-00476-3
L1 = CMP-70ddb8c9bb54af1a-1: Power inductor, shielded, 20% tol, SMT, RoHS, halogen f; Lead-Free Status: Contains Lead; Manufacturer Part Number: XAL7070-472MEB; Mounting Style: Surface Mount; Lifecycle Status: Active; Octopart Url: https://octopart.com/xal7070-472meb-coilcraft-18804463; RoHS: Compliant; OctopartID: 70ddb8c9bb54af1a; Packaging: Reel
Q6 = CMP-7da2b0d499b7a265-2: as Q3 on sheet JigInterface; Polarity: Dual N-Channel; Footprint: PCB-qj1nrqbgj5udp5r3frdj-1; RoHS: Compliant; OctopartID: 7da2b0d499b7a265; Manufacturer Part Number: UT6K3TCR; Operating Temperature: 150 °C (max); Octopart URL: https://octopart.com/ut6k3tcr-rohm-75284851
R50 = CMP-0800c38b3cf2d7c7-3: Generic RES 0603, =Resistance+','+Tolerance+','+Case; Manufacturer Part Number: WSLP0603R0500FEB; Case/Package (SI): 1608; Lead-Free Status: Lead Free; Power Rating: 63.0 mW; Voltage: 50V; ELV Compliant: Compliant; Tolerance: ±1%; Temperature Coefficient: -50.0 ppm/°C to 50.0 ppm/°C; Octopart URL: TBD; Number of Pins: 2; Mounting Style: Surface Mount; Packaging: Tape & Reel (TR); Lifecycle Status: Active; RoHS: Compliant; Case: 0603; Operating Temperature: -55.0 °C to 125 °C; REACH SVHC Compliance: No SVHC; Footprint: PCB-0002-00066-3; OctopartID: a8e96364fc37772e
R69 = CMP-3902036-3: Generic RES 0402, =Resistance+','+Tolerance+','+Case; Manufacturer Part Number: MFSA0402R0100FAM; Lead-Free Status: Lead Free; Voltage: 50.0 V; Power: 0.063 W; Mounting Style: Surface Mount; RoHS: Compliant; Number of Pins: 2; Tolerance: ±1%; Octopart Url: TBD; Case: 0402; OctopartID: 26dced8948c2f91b
R70 R71 = CMP-3902036-3: as R61 on sheet JigInterface; Mounting Style: Surface Mount; RoHS: Compliant; Number of Pins: 2; Tolerance: ±1%; Octopart Url: TBD; Case: 0402; OctopartID: 26dced8948c2f91b
R73 R76 R80 = CMP-0800c38b3cf2d7c7-3: Generic RES 0603, =Resistance+','+Tolerance+','+Case; Manufacturer Part Number: RT0603FRE1320KL; Case/Package (SI): 1608; Lead-Free Status: Lead Free; Power Rating: 63.0 mW; Voltage: 50V; ELV Compliant: Compliant; Tolerance: ±1%; Temperature Coefficient: -50.0 ppm/°C to 50.0 ppm/°C; Octopart URL: TBD; Number of Pins: 2; Mounting Style: Surface Mount; Packaging: Tape & Reel (TR); Lifecycle Status: Active; RoHS: Compliant; Case: 0603; Operating Temperature: -55.0 °C to 125 °C; REACH SVHC Compliance: No SVHC; Footprint: PCB-0002-00066-3; OctopartID: a8e96364fc37772e
R75 = CMP-3902036-3: Generic RES 0402, =Resistance+','+Tolerance+','+Case; Manufacturer Part Number: TBD; Lead-Free Status: Lead Free; Voltage: 50.0 V; Power: 0.063 W; Mounting Style: Surface Mount; RoHS: Compliant; Number of Pins: 2; Tolerance: ±1%; Octopart Url: TBD; Case: 0402; OctopartID: 26dced8948c2f91b
R77 R143 = CMP-0800c38b3cf2d7c7-3: Generic RES 0603, =Resistance+','+Tolerance+','+Case; Manufacturer Part Number: MCT06030C1002FP500; Case/Package (SI): 1608; Lead-Free Status: Lead Free; Power Rating: 63.0 mW; Voltage: 50V; ELV Compliant: Compliant; Tolerance: ±1%; Temperature Coefficient: -50.0 ppm/°C to 50.0 ppm/°C; Octopart URL: TBD; Number of Pins: 2; Mounting Style: Surface Mount; Packaging: Tape & Reel (TR); Lifecycle Status: Active; RoHS: Compliant; Case: 0603; Operating Temperature: -55.0 °C to 125 °C; REACH SVHC Compliance: No SVHC; Footprint: PCB-0002-00066-3; OctopartID: a8e96364fc37772e
R78 = CMP-0800c38b3cf2d7c7-3: as R22 on sheet PowerDist; Octopart URL: TBD; Number of Pins: 2; Mounting Style: Surface Mount; Packaging: Tape & Reel (TR); Lifecycle Status: Active; RoHS: Compliant; Case: 0603; Operating Temperature: -55.0 °C to 125 °C; REACH SVHC Compliance: No SVHC; Footprint: PCB-0002-00066-3; OctopartID: a8e96364fc37772e
R79 = CMP-0800c38b3cf2d7c7-3: as R18-R20 on sheet PowerDist; Octopart URL: TBD; Number of Pins: 2; Mounting Style: Surface Mount; Packaging: Tape & Reel (TR); Lifecycle Status: Active; RoHS: Compliant; Case: 0603; Operating Temperature: -55.0 °C to 125 °C; REACH SVHC Compliance: No SVHC; Footprint: PCB-0002-00066-3; OctopartID: a8e96364fc37772e
R83 R84 = CMP-0800c38b3cf2d7c7-3: Generic RES 0603, =Resistance+','+Tolerance+','+Case; Manufacturer Part Number: RT0603FRE10200RL; Case/Package (SI): 1608; Lead-Free Status: Lead Free; Power Rating: 63.0 mW; Voltage: 50V; ELV Compliant: Compliant; Tolerance: ±1%; Temperature Coefficient: -50.0 ppm/°C to 50.0 ppm/°C; Octopart URL: TBD; Number of Pins: 2; Mounting Style: Surface Mount; Packaging: Tape & Reel (TR); Lifecycle Status: Active; RoHS: Compliant; Case: 0603; Operating Temperature: -55.0 °C to 125 °C; REACH SVHC Compliance: No SVHC; Footprint: PCB-0002-00066-3; OctopartID: a8e96364fc37772e
RL2 = CMP-147564696-2: Coto Mosfet - 1 Form A, 5A, 20V Max/ Tape-Reel; OctopartID: 147564696; Manufacturer Part Number: C241S; Octopart Url: https://octopart.com/c241s-coto-147564696
U13 = CMP-947c5c4360184bbb-17: 36-V, Bi-Directional, Ultra-High Accuracy, Low-/High-Side, I2C Out Current/Power Monitor w/ Alert 10-VSSOP -40 to 125; Manufacturer Part Number: INA226AIDGST
U17 = CMP-277ee9be38fdf8b9-1: 30-V 8-A buck-boost converter with I²C interface 21-VQFN-HR -40 to 125; Octopart Url: https://octopart.com/tps55289ryqr-texas+instruments-130693861; Manufacturer Part Number: TPS55289RYQR; Lifecycle Status: Not Listed by Manufacturer; OctopartID: 277ee9be38fdf8b9
U26 = CMP-2b7ce7b2db7ff4bb-4: as U5 on sheet PowerDist; OctopartID: 2b7ce7b2db7ff4bb; Manufacturer Part Number: TLV75901PDRVR; Footprint: PCB-6kp9dl1mk9yrlugndkjx-1; RoHS: Compliant; Octopart URL: https://octopart.com/tlv75901pdrvr-texas+instruments-96785765; Number of Pins: 6; Lifecycle Status: Pre-Release; Case/Package: WSON; Operating Temperature: -40.0 °C to 125 °C

## Sheet Teensy4.SchDoc
size Letter; SheetNumber: 3; SheetTotal: 15
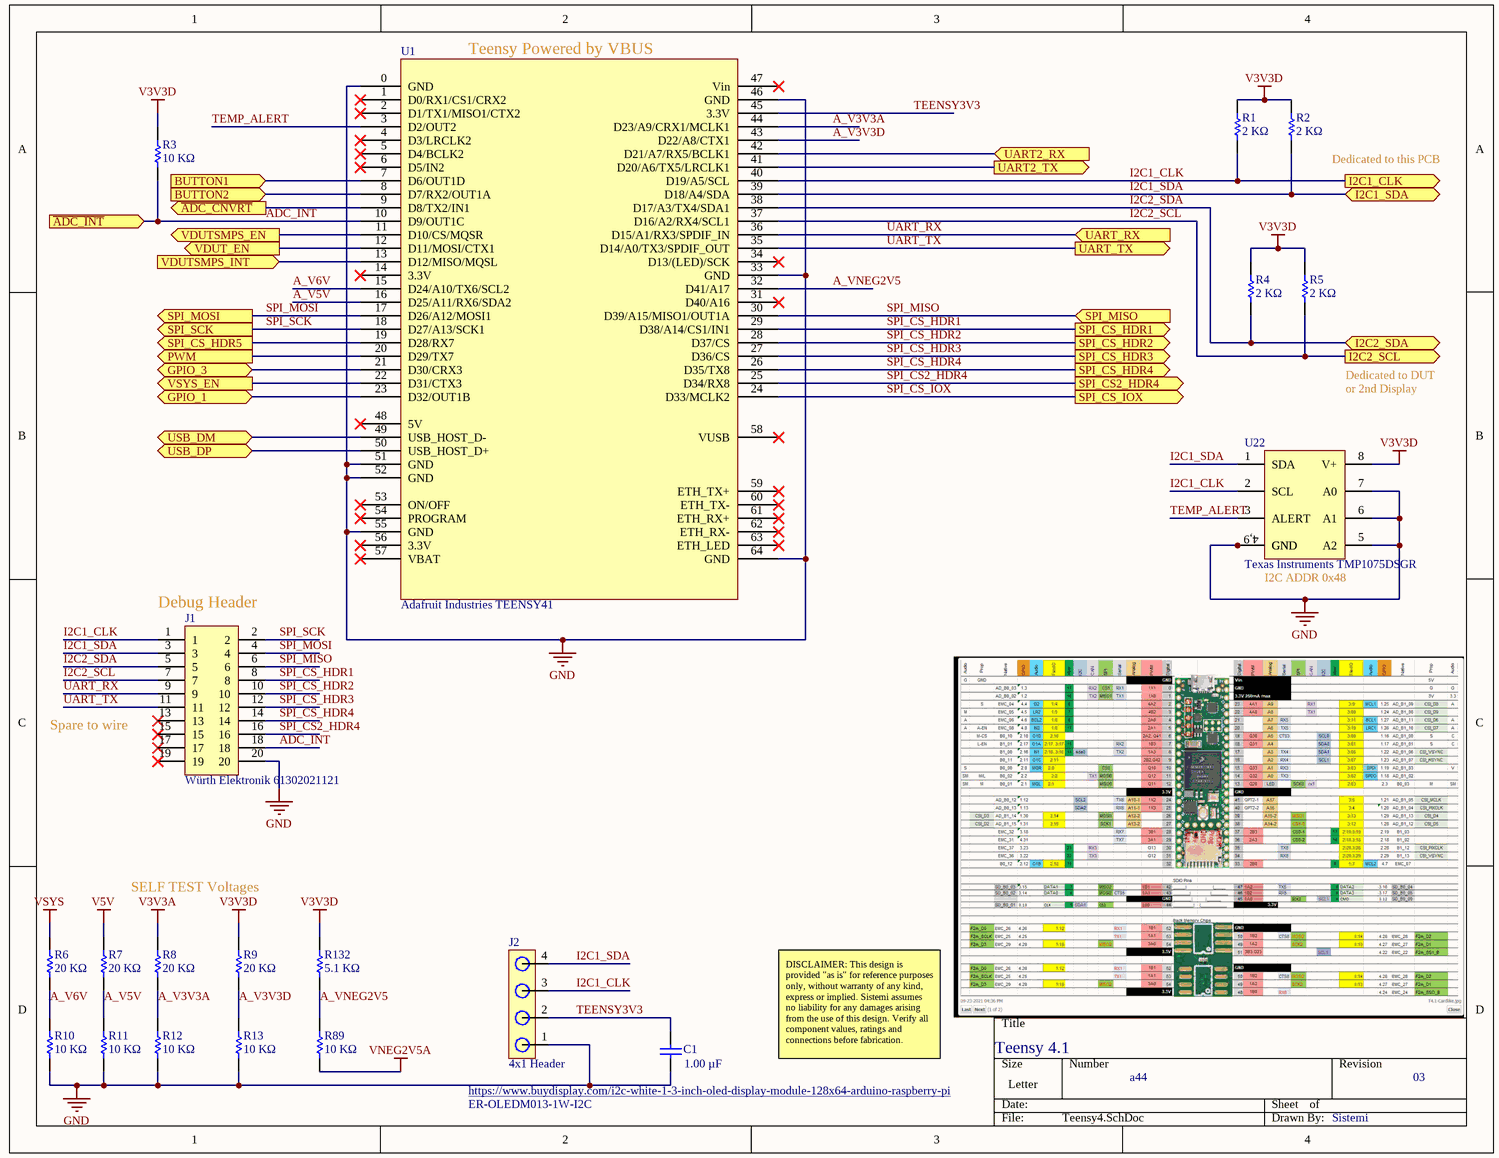
[diagram p11: Teensy4.SchDoc]

### Parts
C1  Capacitance: 1.00 µF  [CAPC1608X90X35NL15T15]  (hidden comment: Samsung CL10B105KA8NNNC)
J1  Würth Elektronik 61302021121  [PCB-nk6cd1c3p7lqby8wsdwb-1]
J2  4x1 Header  [PCB-frzzw7wnfsmgwg7mpl31-1]
R1  Resistance: 2 KΩ  [RESC1608X55X30ML15T15]  (hidden comment: Generic RES 0603)
R2  Resistance: 2 KΩ  [RESC1608X55X30ML15T15]  (hidden comment: Generic RES 0603)
R3  Resistance: 10 KΩ  [RESC1608X55X30ML15T15]  (hidden comment: Generic RES 0603)
R4  Resistance: 2 KΩ  [RESC1608X55X30ML15T15]  (hidden comment: Generic RES 0603)
R5  Resistance: 2 KΩ  [RESC1608X55X30ML15T15]  (hidden comment: Generic RES 0603)
R6  Resistance: 20 KΩ  [RESC1608X55X30ML15T15]  (hidden comment: Generic RES 0603)
R7  Resistance: 20 KΩ  [RESC1608X55X30ML15T15]  (hidden comment: Generic RES 0603)
R8  Resistance: 20 KΩ  [RESC1608X55X30ML15T15]  (hidden comment: Generic RES 0603)
R9  Resistance: 20 KΩ  [RESC1608X55X30ML15T15]  (hidden comment: Generic RES 0603)
R10  Resistance: 10 KΩ  [RESC1608X55X30ML15T15]  (hidden comment: Generic RES 0603)
R11  Resistance: 10 KΩ  [RESC1608X55X30ML15T15]  (hidden comment: Generic RES 0603)
R12  Resistance: 10 KΩ  [RESC1608X55X30ML15T15]  (hidden comment: Generic RES 0603)
R13  Resistance: 10 KΩ  [RESC1608X55X30ML15T15]  (hidden comment: Generic RES 0603)
R89  Resistance: 10 KΩ  [RESC1608X55X30ML15T15]  (hidden comment: Generic RES 0603)
R132  Resistance: 5.1 KΩ  [RESC1608X55X30ML15T15]  (hidden comment: Generic RES 0603)
U1  Adafruit Industries TEENSY41  [Adafruit Industries TEENSY41-Footprint-1]
U22  Texas Instruments TMP1075DSGR  [PCB-22psa42mhiow8cw0mt2a-1]

### Ports
BUTTON1 (in), BUTTON2 (in), GPIO_1 (bidir), GPIO_3 (bidir), I2C1_CLK (out), I2C1_SDA (bidir), I2C2_SCL (out), I2C2_SDA (bidir), PWM (out), SPI_CS2_HDR4 (out), SPI_CS_HDR1 (out), SPI_CS_HDR2 (out), SPI_CS_HDR3 (out), SPI_CS_HDR4 (out), SPI_CS_HDR5 (out), SPI_CS_IOX (out), SPI_MISO (in), SPI_MOSI (out), SPI_SCK (out), UART2_RX (in), UART2_TX (out), UART_RX (in), UART_TX (out), USB_DM (bidir), USB_DP (bidir), VDUT_EN (out), VDUTSMPS_EN (out), VDUTSMPS_INT (in), VSYS_EN (out), ~{ADC_CNVRT} (out), ~{ADC_INT} (in)

### Nets
GND: C1.1 J1.20 J2.1 R10.1 R11.1 R12.1 R13.1 U1.0(GND) U1.33(GND) U1.46(GND) U1.51(GND) U1.52(GND) U1.55(GND) U1.64(GND) U22.4(GND) U22.5(A2) U22.6(A1) U22.7(A0) U22.9(GND)
V3V3A: R8.2
V3V3D: R1.2 R2.2 R3.1 R4.2 R5.2 R9.2 R132.2 U22.8(V+)
V5V: R7.2
VNEG2V5A: R89.1
VSYS: R6.2
A_V3V3A: R8.1 R12.2 U1.44(D23/A9/CRX1/MCLK1)
A_V3V3D: R9.1 R13.2 U1.43(D22/A8/CTX1)
A_V5V: R7.1 R11.2 U1.16(D25/A11/RX6/SDA2)
A_V6V: R6.1 R10.2 U1.15(D24/A10/TX6/SCL2)
A_VNEG2V5: R89.2 R132.1 U1.32(D41/A17)
ADC_INT: J1.18 R3.2 U1.10(D9/OUT1C) ; port ~{ADC_INT}
I2C1_CLK: J1.1 J2.3 R1.1 U1.40(D19/A5/SCL) U22.2(SCL) ; port I2C1_CLK
I2C1_SDA: J1.3 J2.4 R2.1 U1.39(D18/A4/SDA) U22.1(SDA) ; port I2C1_SDA
I2C2_SCL: J1.7 R5.1 U1.37(D16/A2/RX4/SCL1) ; port I2C2_SCL
I2C2_SDA: J1.5 R4.1 U1.38(D17/A3/TX4/SDA1) ; port I2C2_SDA
SPI_CS2_HDR4: J1.16 U1.25(D34/RX8) ; port SPI_CS2_HDR4
SPI_CS_HDR1: J1.8 U1.29(D38/A14/CS1/IN1) ; port SPI_CS_HDR1
SPI_CS_HDR2: J1.10 U1.28(D37/CS) ; port SPI_CS_HDR2
SPI_CS_HDR3: J1.12 U1.27(D36/CS) ; port SPI_CS_HDR3
SPI_CS_HDR4: J1.14 U1.26(D35/TX8) ; port SPI_CS_HDR4
SPI_CS_IOX: U1.24(D33/MCLK2) ; port SPI_CS_IOX
SPI_MISO: J1.6 U1.30(D39/A15/MISO1/OUT1A) ; port SPI_MISO
SPI_MOSI: J1.4 U1.17(D26/A12/MOSI1) ; port SPI_MOSI
SPI_SCK: J1.2 U1.18(D27/A13/SCK1) ; port SPI_SCK
TEENSY3V3: C1.2 J2.2 U1.45(3.3V)
TEMP_ALERT: U1.3(D2/OUT2) U22.3(ALERT)
UART_RX: J1.9 U1.36(D15/A1/RX3/SPDIF_IN) ; port UART_RX
UART_TX: J1.11 U1.35(D14/A0/TX3/SPDIF_OUT) ; port UART_TX
VDUT_EN: U1.12(D11/MOSI/CTX1) ; port VDUT_EN
VDUTSMPS_EN: U1.11(D10/CS/MQSR) ; port VDUTSMPS_EN
VDUTSMPS_INT: U1.13(D12/MISO/MQSL) ; port VDUTSMPS_INT
NetJ14_14: U1.23(D32/OUT1B) ; port GPIO_1
NetJ15_15: U1.41(D20/A6/TX5/LRCLK1) ; port UART2_TX
NetJ15_17: U1.42(D21/A7/RX5/BCLK1) ; port UART2_RX
NetR98_1: U1.50(USB_HOST_D+) ; port USB_DP
NetR100_1: U1.49(USB_HOST_D-) ; port USB_DM
NetR146_2: U1.22(D31/CTX3) ; port VSYS_EN
NetU1_7: U1.7(D6/OUT1D) ; port BUTTON1
NetU1_8: U1.8(D7/RX2/OUT1A) ; port BUTTON2
NetU1_9: U1.9(D8/TX2/IN1) ; port ~{ADC_CNVRT}
NetU1_19: U1.19(D28/RX7) ; port SPI_CS_HDR5
NetU1_20: U1.20(D29/TX7) ; port PWM
NetU1_21: U1.21(D30/CRX3) ; port GPIO_3

Not connected (* = marked no-connect by the designer): J1 13* 15* 17* 19*; U1 1(D0/RX1/CS1/CRX2)* 2(D1/TX1/MISO1/CTX2)* 4(D3/LRCLK2)* 5(D4/BCLK2)* 6(D5/IN2)* 14(3.3V)* 31(D40/A16)* 34(D13/(LED)/SCK)* 47(Vin)* 48(5V)* 53(ON/OFF)* 54(PROGRAM)* 56(3.3V)* 57(VBAT)* 58(VUSB)* 59(ETH_TX+)* 60(ETH_TX-)* 61(ETH_RX+)* 62(ETH_RX-)* 63(ETH_LED)*

### Notes on the sheet
- (near U1) Teensy Powered by VBUS
- (near R2) Dedicated to this PCB
- Dedicated to DUT
- or 2nd Display
- (near J1) Debug Header
- (near U22) I2C ADDR 0x48
- (near J1) Spare to wire
- SELF TEST Voltages
- https://www.buydisplay.com/i2c-white-1-3-inch-oled-display-module-128x64-arduino-raspberry-pi
- ER-OLEDM013-1W-I2C
- DISCLAIMER: This design is provided "as is" for reference purposes only, without warranty of any kind, express or implied. Sistemi assumes no liability for any damages arising from the use of this design. Verify all component values, ratings and connections before fabrication.
- Teensy 4.1
- a44
- 03
- Sistemi
- (in symbol CMP-0b87c75f2930d440-2) 4,9

### Library data of the parts
C1 = CMP-7473528-5: as C51 on sheet JigInterface; RoHS: Compliant; Mounting Style: Surface Mount; Footprint: PCB-0002-00062-3; Octopart URL: http://octopart.com/cl10b105ka8nnnc-samsung-19831597; Case/Package: 0603; OctopartID: ce7a065e703111bd; Dielectric Characteristic: X7R
J1 = CMP-005cc8a3733edf9b-7: THT Vertical Pin Header WR-PHD, Pitch 2.54 mm, Dual Row, 20 pins; Current Rating: 3.00 A; Dielectric Withstanding Voltage: 500 V; Pin Pitch: 2.54 mm; Operating Voltage: 250 V; Number of Contacts: 20; Contact Resistance: 20.0 mΩ; Gender: Male; Contact Material: Copper; Footprint: PCB-005cc8a3733edf9b-1; Mounting Style: Through Hole; Color: Black; Contact Plating: Gold; REACH SVHC Compliance: No SVHC; RoHS: Compliant; Octopart URL: https://octopart.com/61302021121-w%C3%BCrth+elektronik-32855556; Packaging: Bag; Orientation: Vertical; OctopartID: 005cc8a3733edf9b; Number of Pins: 20; Operating Temperature: -40.0 °C (min); Manufacturer Part Number: 61302021121
J2 = CMP-2ffce6f22d89f03b-6: 2.54mm 100mil header; Manufacturer Part Number: TSW-102-07-G-D; Number of Positions: 4; Gender: Male; Lead-Free Status: Lead Free; OctopartID: 2ffce6f22d89f03b; Pin Pitch: 2.54 mm; REACH SVHC Compliance: No SVHC; Packaging: Bulk; Color: Black; Octopart URL: https://octopart.com/tsw-102-07-g-d-samtec-272147; Contact Plating: Gold; Size-Width: 5.08 mm; Mounting Style: Through Hole; Size-Height: 2.54 mm; Housing Color: Black; Size-Length: 5.08 mm; Operating Temperature: 125 °C (max); Number of Contacts: 4; Housing Material: Plastic; RoHS: Compliant; Contact Material: Phosphor Bronze; Number of Rows: 2
R1 R2 R4 R5 = CMP-0800c38b3cf2d7c7-3: Generic RES 0603, =Resistance+','+Tolerance+','+Case; Manufacturer Part Number: RE0603FRE072KL; Case/Package (SI): 1608; Lead-Free Status: Lead Free; Power Rating: 63.0 mW; Voltage: 50V; ELV Compliant: Compliant; Tolerance: ±1%; Temperature Coefficient: -50.0 ppm/°C to 50.0 ppm/°C; Octopart URL: TBD; Number of Pins: 2; Mounting Style: Surface Mount; Packaging: Tape & Reel (TR); Lifecycle Status: Active; RoHS: Compliant; Case: 0603; Operating Temperature: -55.0 °C to 125 °C; REACH SVHC Compliance: No SVHC; Footprint: PCB-0002-00066-3; OctopartID: a8e96364fc37772e
R3 R10-R13 R89 = CMP-0800c38b3cf2d7c7-3: as R77 on sheet VDUT; Octopart URL: TBD; Number of Pins: 2; Mounting Style: Surface Mount; Packaging: Tape & Reel (TR); Lifecycle Status: Active; RoHS: Compliant; Case: 0603; Operating Temperature: -55.0 °C to 125 °C; REACH SVHC Compliance: No SVHC; Footprint: PCB-0002-00066-3; OctopartID: a8e96364fc37772e
R6-R9 = CMP-0800c38b3cf2d7c7-3: as R73 on sheet VDUT; Octopart URL: TBD; Number of Pins: 2; Mounting Style: Surface Mount; Packaging: Tape & Reel (TR); Lifecycle Status: Active; RoHS: Compliant; Case: 0603; Operating Temperature: -55.0 °C to 125 °C; REACH SVHC Compliance: No SVHC; Footprint: PCB-0002-00066-3; OctopartID: a8e96364fc37772e
R132 = CMP-0800c38b3cf2d7c7-3: as R18-R20 on sheet PowerDist; Octopart URL: TBD; Number of Pins: 2; Mounting Style: Surface Mount; Packaging: Tape & Reel (TR); Lifecycle Status: Active; RoHS: Compliant; Case: 0603; Operating Temperature: -55.0 °C to 125 °C; REACH SVHC Compliance: No SVHC; Footprint: PCB-0002-00066-3; OctopartID: a8e96364fc37772e
U1 = CMP-9ae65445f7a64521-2: PJRC Teensy 4.1 Development Board; OctopartID: 9ae65445f7a64521; Manufacturer Part Number: TEENSY41; Octopart Url: https://octopart.com/teensy41-adafruit+industries-128534566
U22 = CMP-0b87c75f2930d440-2: High-accuracy upgrade to industry standard LM75 / TMP75 I2C temperature sensor 8-WSON -55 to 125; Case/Package: WSON; RoHS: Compliant; Octopart URL: https://octopart.com/tmp1075dsgr-texas+instruments-97650641; Lifecycle Status: Pre-Release; Manufacturer Part Number: TMP1075DSGR; OctopartID: 0b87c75f2930d440; Number of Pins: 8